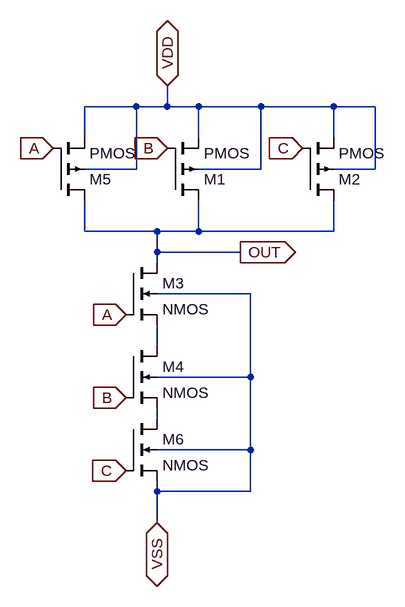
[diagram p0: schematic NAND3.asc]
NAND3.asc, the LTspice schematic file:
Version 4.1
SHEET 1 880 680
WIRE 160 -688 80 -688
WIRE 208 -688 208 -720
WIRE 208 -688 160 -688
WIRE 256 -688 208 -688
WIRE 352 -688 256 -688
WIRE 464 -688 352 -688
WIRE 528 -688 464 -688
WIRE 80 -640 80 -688
WIRE 256 -640 256 -688
WIRE 464 -640 464 -688
WIRE 160 -592 160 -688
WIRE 160 -592 80 -592
WIRE 352 -592 352 -688
WIRE 352 -592 256 -592
WIRE 528 -592 528 -688
WIRE 528 -592 464 -592
WIRE 80 -496 80 -544
WIRE 192 -496 80 -496
WIRE 256 -496 256 -544
WIRE 256 -496 192 -496
WIRE 464 -496 464 -544
WIRE 464 -496 256 -496
WIRE 192 -464 192 -496
WIRE 320 -464 192 -464
WIRE 192 -448 192 -464
WIRE 336 -400 192 -400
WIRE 192 -320 192 -352
WIRE 336 -272 336 -400
WIRE 336 -272 192 -272
WIRE 192 -208 192 -224
WIRE 336 -160 336 -272
WIRE 336 -160 192 -160
WIRE 192 -96 192 -112
WIRE 336 -96 336 -160
WIRE 336 -96 192 -96
WIRE 192 -48 192 -96
FLAG 208 -720 VDD
IOPIN 208 -720 BiDir
FLAG 192 -48 VSS
IOPIN 192 -48 BiDir
FLAG 32 -624 A
IOPIN 32 -624 In
FLAG 208 -624 B
IOPIN 208 -624 In
FLAG 144 -368 A
IOPIN 144 -368 In
FLAG 144 -240 B
IOPIN 144 -240 In
FLAG 320 -464 OUT
IOPIN 320 -464 Out
FLAG 416 -624 C
IOPIN 416 -624 In
FLAG 144 -128 C
IOPIN 144 -128 In
SYMBOL nmos4 144 -448 R0
SYMATTR InstName M3
SYMBOL nmos4 144 -320 R0
SYMATTR InstName M4
SYMBOL pmos4 32 -544 M180
SYMATTR InstName M5
SYMBOL pmos4 208 -544 M180
SYMATTR InstName M1
SYMBOL pmos4 416 -544 M180
SYMATTR InstName M2
SYMBOL nmos4 144 -208 R0
SYMATTR InstName M6

The netlist it stands for:
* NAND3.asc
M3 OUT A N001 VSS NMOS
M4 N001 B N002 VSS NMOS
M5 OUT A VDD VDD PMOS
M1 OUT B VDD VDD PMOS
M2 OUT C VDD VDD PMOS
M6 N002 C VSS VSS NMOS
.model NMOS NMOS
.model PMOS PMOS
.lib standard.mos
.backanno
.end